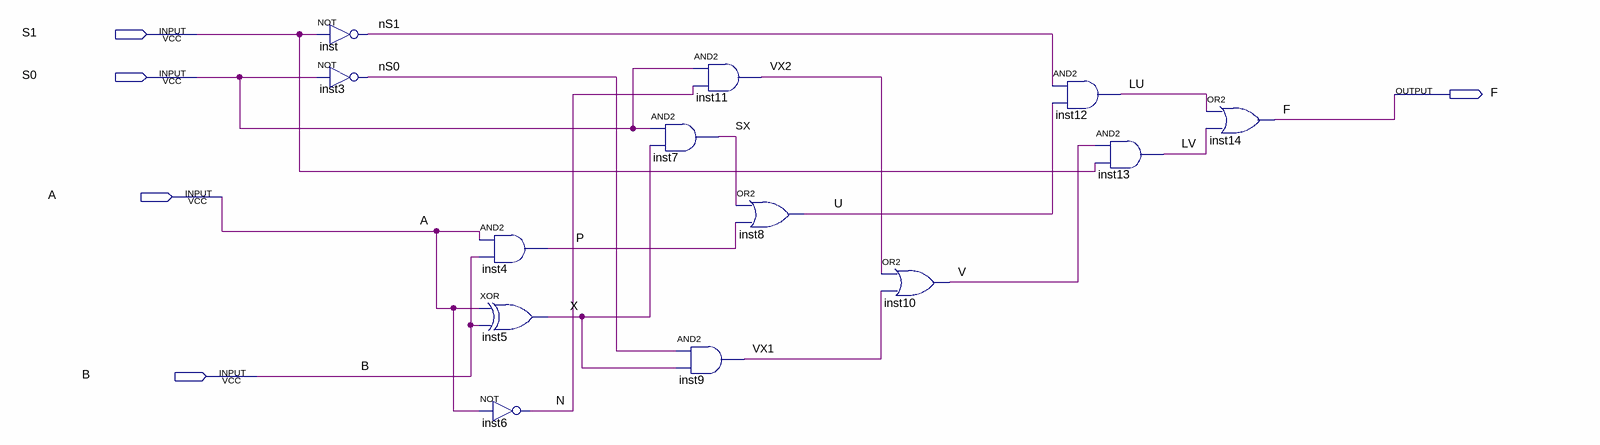
[diagram p0: schematic sheet]
// Quartus schematic alu_logic.bdf as structural Verilog: 13 symbols, 5 pins
module alu_logic (
  input  S1,
  input  S0,
  input  A,
  input  B,
  output F
);

  wire LU, LV, N, nS0, nS1, P, SX, U, V, VX1, VX2, X;

  not inst (nS1, S1);
  not inst3 (nS0, S0);
  and inst4 (P, A, B);
  xor inst5 (X, A, B);
  not inst6 (N, A);
  and inst7 (SX, S0, X);
  and inst9 (VX1, nS0, X);
  and inst11 (VX2, S0, N);
  or inst8 (U, SX, P);
  or inst10 (V, VX2, VX1);
  and inst12 (LU, nS1, U);
  and inst13 (LV, V, S1);
  or inst14 (F, LU, LV);
endmodule
